# Altium schematic sheet Connector_Section.SchDoc
size A4; DocumentNumber: 9; SheetNumber: 9; SheetTotal: 8
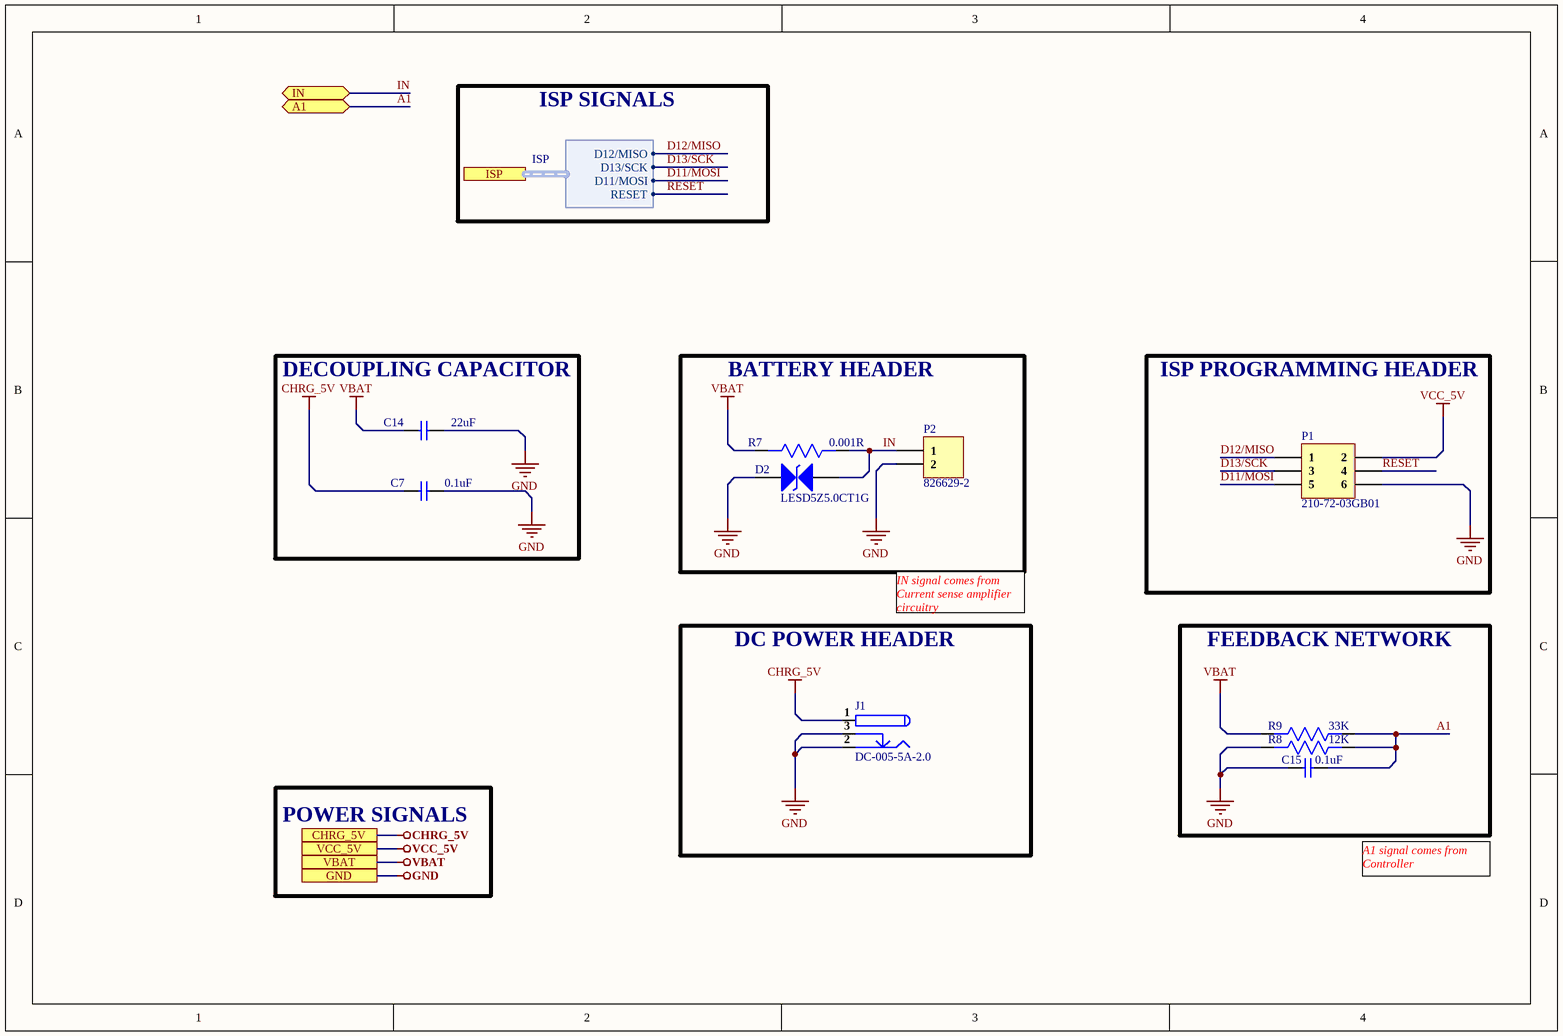
[diagram p0: Connector_Section.SchDoc]

## Parts
C7  0.1uF  [Cap0603]
C14  22uF  [Cap0805]
C15  0.1uF  [Cap0603]
D2  LESD5Z5.0CT1G  [LESD5Z5.0CT1G]
J1  DC-005-5A-2.0  [DC-005-5A-2.0]
P1  210-72-03GB01  [HDR2X3]
P2  826629-2  [HDR1X2]
R7  0.001R  [RES 2512]
R8  12K  [Res0603]
R9  33K  [Res0603]

## Blocks framed on the sheet
DECOUPLING CAPACITOR: C7 C14
BATTERY HEADER: D2 P2 R7
ISP PROGRAMMING HEADER: P1
DC POWER HEADER: J1
FEEDBACK NETWORK: C15 R8 R9

## Ports
A1 (bidir), CHRG_5V, GND, IN (bidir), ISP (harness ISP), VBAT, VCC_5V

## Harnesses
ISP: D12/MISO, D13/SCK, D11/MOSI, RESET

## Nets
CHRG_5V: C7.1 J1.1 ; port CHRG_5V
GND: C7.2 C14.2 C15.2 D2.1(A) J1.2 J1.3 P1.6 P2.2 R8.2 ; port GND
VBAT: C14.1 R7.2 R9.2 ; port VBAT
VCC_5V: P1.2 ; port VCC_5V
A1: C15.1 R8.1 R9.1 ; port A1
D11/MOSI: P1.5 ; port ISP.D11/MOSI
D12/MISO: P1.1 ; port ISP.D12/MISO
D13/SCK: P1.3 ; port ISP.D13/SCK
IN: D2.2(A) P2.1 R7.1 ; port IN
RESET: P1.4 ; port ISP.RESET

## Notes on the sheet
- ISP SIGNALS
- IN signal comes from Current sense amplifier circuitry
- POWER SIGNALS
- A1 signal comes from Controller

## Library data of the parts
C7 C15 = CC0603ZRY5V9BB104: CAP CER 0.1UF 50V Y5V 0603; Manufacturer: Yageo; Capacitance: 100nF; Tolerance: 80%; Supplier 1: Digi-Key; Manufacturer Part Number: CC0603ZRY5V9BB104; Stock 1: 15000880; Pricing 1: 1=0.1, 10=0.075, 100=0.0334, 500=0.02386, 1000=0.01874 (USD); Mount: Surface Mount; Case/Package: 0603; Number of Pins: 2; Case Code (Metric): 1608; Case Code (Imperial): 0603; Min Operating Temperature: -30°C; Max Operating Temperature: 85°C; Dielectric: Y5V; Voltage Rating: 50V; Package Quantity: 1; Packaging: Tape and Reel; Voltage Rating (DC): 50V; Termination: SMD/SMT; Composition: Ceramic; Voltage: 50V; Length: 1.6mm; Height: 0.8mm; Width: 0.031inch; Thickness: 0.035inch; Depth: 0.8mm; Radiation Hardening: No; REACH SVHC: No SVHC; Lead Free: Lead Free; Halogen Free: Halogen Free; ComponentLink1URL: http://www.yageo.com/documents/recent/UPY-GPHC_Y5V_6.3V-to-50V_8.pdf?src-supplier=Digi-Key; ComponentLink1Description: http://www.yageo.com/documents/recent/UPY-GPHC_Y5V_6.3V-to-50V_8.pdf?src-supplier=Digi-Key; ComponentLink2URL: http://www.yageo.com/documents/recent/UPY-GPHC_Y5V_6.3V-to-50V_5.pdf?src-supplier=Avnet+Europe; ComponentLink2Description: http://www.yageo.com/documents/recent/UPY-GPHC_Y5V_6.3V-to-50V_5.pdf?src-supplier=Avnet+Europe; ComponentLink3URL: https://www.verical.com/server-webapp/html/getDatasheet?partID=403611&src-supplier=Verical; ComponentLink3Description: https://www.verical.com/server-webapp/html/getDatasheet?partID=403611&src-supplier=Verical; ComponentLink4URL: http://www.mouser.com/ds/2/447/Yageo_UPY-GP_NP0_16V-to-50V_9-358835.pdf?src-supplier=Mouser; ComponentLink4Description: http://www.mouser.com/ds/2/447/Yageo_UPY-GP_NP0_16V-to-50V_9-358835.pdf?src-supplier=Mouser; ComponentLink5URL: http://www.farnell.com/datasheets/1132289.pdf?src-supplier=Element14; ComponentLink5Description: http://www.farnell.com/datasheets/1132289.pdf?src-supplier=Element14; Supplier Part Number 1: 311-1343-1-ND
C14 = C2012X5R1V226MT000E: CAP CER 22UF 35V X5R 0805
D2 = LESD5Z5.0CT1G: SOD-523 ESD Protection Devices ROHS; Manufacturer: UMW; Value: Custom; Manufacturer Part No: LESD5Z5.0CT1G; Package: SOD-523; ComponentLink1Description: LCSC; ComponentLink1URL: https://lcsc.com/product-detail/span-style-background-color-ff0-ESD-span-Protection-Devices_UMW-Youtai-Semiconductor-Co-Ltd-LESD5Z5-0CT1G_C2833276.html
J1 = DC-005-5A-2.0: DC Power Receptacle 2mm 6.2mm 5A 24V Plugin AC/DC Power Connectors ROHS; Manufacturer: XKB Connectivity; Manufacutrer Part No:: DC-005-5A-2.0; Package: Custom; ComponentLink1Description: New link; ComponentLink1URL: https://datasheet.lcsc.com/lcsc/2110151630_XKB-Connectivity-DC-005-5A-2-0_C381116.pdf
P1 = 210-72-03GB01: Straight Square Pins 2.5mm 6.1mm -40℃~+105℃ 2 3mm 6 2.54mm Black Brass 2x3P 2.54mm Plugin,P=2.54mm Pin Headers ROHS; Manufacturer: PINREX; Manufacturer Part no:: 210-72-03GB01; Package: Custom; ComponentLink1Description: New link; ComponentLink1URL: https://lcsc.com/product-detail/Pin-Headers_PINREX-210-72-03GB01_C402781.html
P2 = 826629-2: CONN HEADER VERT 2POS 2.54MM; Manufacturer: TE Connectivity; Manufacturer Part Number: 8266292; Number of Contacts: 2; Connector Type: Plug,Header,Pin; Current Rating: 3A; Board Standoff: No (Without); High Speed Serial Data Connector: No; PCB Mount Retention: Without; Gender: Male; PCB Mounting Orientation: Vertical; Contact Post Length: 0.1259inch; Plating Thickness: 0.8um; Supplier 1: RSComponents; RoHS: Yes; Category: Board to Board Connectors; Mount: Straddle Mount; Contact Plating: Gold,Tin; Contact Material: Bronze; Color: Green; Housing Color: Green; Housing Material: PBT; Contact Shape: Square; Min Operating Temperature: -65°C; Max Operating Temperature: 105°C; Number of Rows: 1; Termination: Through Hole; Number of Positions: 2; Packaging: Carton; Package Quantity: 3000; Series: AMPMODU MOD II; Contact Type: Male Pin; Contact Gender: Male; Orientation: Straight; Contact Protection: No (Without); Gasket: No (Without); High Temperature Housing: No; Keyed: No; Mating Alignment: No (Without); Mating Connector Lock: No (Without); Selectively Loaded: No (Without); Stabilizers: No (Without); Strain Relief: No (Without); Length: 5.08mm; Pitch: 2.54mm; Contact Mating Length: 6.7mm; Row Spacing: 2.54mm; Depth: 2.5mm; Radiation Hardening: No; Flammability Rating: UL94 V-0; REACH SVHC: No SVHC; ELV: Compliant; Lead Free: Lead Free; ComponentLink1URL: https://datasheet.ciiva.com/11746/0900766b80d7c358-11746248.pdf?src-supplier=RSComponents; ComponentLink1Description: https://datasheet.ciiva.com/11746/0900766b80d7c358-11746248.pdf?src-supplier=RSComponents; ComponentLink2URL: https://datasheet.ciiva.com/30224/8266292-30224019.pdf?src-supplier=Onlinecomponents.com; ComponentLink2Description: https://datasheet.ciiva.com/30224/8266292-30224019.pdf?src-supplier=Onlinecomponents.com; ComponentLink3URL: https://datasheet.ciiva.com/29369/001094754-da-01-en-stiftleiste-1-reihig-0-0826629-2-29369600.pdf?src-supplier=Conrad; ComponentLink3Description: https://datasheet.ciiva.com/29369/001094754-da-01-en-stiftleiste-1-reihig-0-0826629-2-29369600.pdf?src-supplier=Conrad; ComponentLink4URL: https://datasheet.ciiva.com/6857/eng-cd-826629-aa-basefilename-6857135.pdf?src-supplier=Digi-Key; ComponentLink4Description: https://datasheet.ciiva.com/6857/eng-cd-826629-aa-basefilename-6857135.pdf?src-supplier=Digi-Key; ComponentLink5URL: https://datasheet.ciiva.com/14120/eh826629-draw-14120837.pdf?src-supplier=Distrelec; ComponentLink5Description: https://datasheet.ciiva.com/14120/eh826629-draw-14120837.pdf?src-supplier=Distrelec; Supplier Part Number 1: 1361864
R7 = PA2512JKF7W0R001E: RES 0.001 OHM 5% 2W 2512; Manufacturer: YEGEO; Manufacturer Part No:: PA2512JKF7W0R001E; Value: 0.001R; Package: 2512; ComponentLink1Description: New link; ComponentLink1URL: https://www.digikey.ca/en/products/detail/yageo/PA2512JKF7W0R001E/5913675?s=N4IgTCBcDaIAoEEwFYCMYBSBpAYgdgHUAGAJSKNQFEQBdAXyA
R8 = ERJ3EKF1202V: RES SMD 12K OHM 1% 1/10W 0603; Manufacturer: Panasonic; Resistance: 12kR; Temperature Coefficient: 100ppm/°C; Power Rating: 100mW; Voltage Rating: 75V; Supplier 1: RSComponents; Manufacturer Part Number: ERJ3EKF1202V; RoHS: Yes; Category: Chip SMD Resistors; Stock 1: 197000; Pricing 1: 1000=0.00500 (GBP); Mount: Surface Mount; Case/Package: 0603; Number of Pins: 2; Contact Plating: Tin; Case Code (Metric): 1608; Case Code (Imperial): 0603; Weight: 7.1E-05oz; Min Operating Temperature: -55°C; Max Operating Temperature: 155°C; Tolerance: 1%; Resistor Type: Thick Film; Packaging: Tape and Reel; Package Quantity: 5000; Number of Terminations: 2; Termination: SMD/SMT; Max Power Dissipation: 100mW; Voltage Rating (DC): 75V; Features: Automotive AEC-Q200; Series: ERJ; Resistance Tolerance: 1%; Construction: Rectangular; Length: 1.6mm; Width: 0.8mm; Height: 0.45mm; Depth: 0.8mm; Radiation Hardening: No; REACH SVHC: No SVHC; Military Standard: Not; Lead Free: Lead Free; RoHS Compliant: Yes; ComponentLink1URL: https://datasheet.ciiva.com/6138/aoa0000ce2-6138712.pdf?src-supplier=Farnell; ComponentLink1Description: https://datasheet.ciiva.com/6138/aoa0000ce2-6138712.pdf?src-supplier=Farnell; ComponentLink2URL: https://datasheet.ciiva.com/7944/aoa0000ce2-7944617.pdf?src-supplier=Element14; ComponentLink2Description: https://datasheet.ciiva.com/7944/aoa0000ce2-7944617.pdf?src-supplier=Element14; ComponentLink3URL: https://datasheet.ciiva.com/22673/1678782-22673693.pdf?src-supplier=Element14; ComponentLink3Description: https://datasheet.ciiva.com/22673/1678782-22673693.pdf?src-supplier=Element14; ComponentLink4URL: https://datasheet.ciiva.com/22687/1678782-22687413.pdf?src-supplier=Element14; ComponentLink4Description: https://datasheet.ciiva.com/22687/1678782-22687413.pdf?src-supplier=Element14; ComponentLink5URL: https://datasheet.ciiva.com/46420/1678782-46420333.pdf?src-supplier=Element14; ComponentLink5Description: https://datasheet.ciiva.com/46420/1678782-46420333.pdf?src-supplier=Element14; ComponentLink6URL: https://datasheet.ciiva.com/24165/aoa0000ce2-24165037.pdf?src-supplier=Mouser; ComponentLink6Description: https://datasheet.ciiva.com/24165/aoa0000ce2-24165037.pdf?src-supplier=Mouser; ComponentLink7URL: https://datasheet.ciiva.com/16783/70260748-16783400.pdf?src-supplier=Allied+Electronics; ComponentLink7Description: https://datasheet.ciiva.com/16783/70260748-16783400.pdf?src-supplier=Allied+Electronics; ComponentLink8URL: https://datasheet.ciiva.com/30121/aoa0000ce2-30121109.pdf?src-supplier=Onlinecomponents.com; ComponentLink8Description: https://datasheet.ciiva.com/30121/aoa0000ce2-30121109.pdf?src-supplier=Onlinecomponents.com; ComponentLink9URL: https://datasheet.ciiva.com/17211/aoa0000ce2-17211797.pdf?src-supplier=Avnet+Europe; ComponentLink9Description: https://datasheet.ciiva.com/17211/aoa0000ce2-17211797.pdf?src-supplier=Avnet+Europe; ComponentLink10URL: https://datasheet.ciiva.com/16511/aoa0000ce2-16511882.pdf?src-supplier=Avnet+Asia; ComponentLink10Description: https://datasheet.ciiva.com/16511/aoa0000ce2-16511882.pdf?src-supplier=Avnet+Asia; Supplier Part Number 1: 1763579
R9 = AC0603FR-0733KL: Res Thick Film 0603 33K Ohm 1% 1/10W ±100ppm/°C Molded SMD Paper T/R; Manufacturer: Yageo; Resistance: 33kR; Power Rating: 100mW; Voltage Rating: 50V; Supplier 1: Digi-Key; Manufacturer Part Number: AC0603FR-0733KL; RoHS: Yes; Category: Chip SMD Resistors; Stock 1: 9255; Pricing 1: 1=0.10000, 10=0.02900, 100=0.01170, 1000=0.00527, 2500=0.00458 (USD); Case/Package: 0603; Case Code (Imperial): 0603; Case Code (Metric): 1608; Min Operating Temperature: -55°C; Max Operating Temperature: 155°C; Tolerance: 1%; Packaging: Tape and Reel; Resistor Type: Thick Film; Number of Terminations: 2; Termination: SMD/SMT; Max Power Dissipation: 100mW; Temperature Coefficient: 100ppm/°C; Features: Moisture Resistant,Automotive AEC-Q200; Series: AC; Construction: Rectangular; Length: 1.6mm; Width: 0.031inch; Height: 0.022inch; Depth: 0.8mm; Military Standard: Not; Lead Free: Lead Free; RoHS Compliant: Yes; ComponentLink1URL: http://components.arrow.com/part/dataview/0323_03349868?src-supplier=Arrow+Europe; ComponentLink1Description: http://components.arrow.com/part/dataview/0323_03349868?src-supplier=Arrow+Europe; ComponentLink2URL: http://www.yageo.com/NewPortal/yageodocoutput?fileName=/pdf/R-Chip/PYu-AC_51_RoHS_L_6.pdf&src-supplier=Arrow+Electronics; ComponentLink2Description: http://www.yageo.com/NewPortal/yageodocoutput?fileName=/pdf/R-Chip/PYu-AC_51_RoHS_L_6.pdf&src-supplier=Arrow+Electronics; ComponentLink3URL: http://www.yageo.com/NewPortal/yageodocoutput?fileName=/pdf/R-Chip/PYu-AC_51_RoHS_L_6.pdf&src-supplier=Digi-Key; ComponentLink3Description: http://www.yageo.com/NewPortal/yageodocoutput?fileName=/pdf/R-Chip/PYu-AC_51_RoHS_L_6.pdf&src-supplier=Digi-Key; ComponentLink4URL: http://www.yageo.com/documents/recent/PYu-AC_51_RoHS_L_2.pdf?src-supplier=Future+Electronics; ComponentLink4Description: http://www.yageo.com/documents/recent/PYu-AC_51_RoHS_L_2.pdf?src-supplier=Future+Electronics; ComponentLink5URL: http://www.yageo.com/NewPortal/yageodocoutput?fileName=/pdf/R-Chip/PYu-AC_51_RoHS_L_6.pdf&src-supplier=Mouser; ComponentLink5Description: http://www.yageo.com/NewPortal/yageodocoutput?fileName=/pdf/R-Chip/PYu-AC_51_RoHS_L_6.pdf&src-supplier=Mouser; ComponentLink6URL: http://www.yageo.com/NewPortal/yageodocoutput?fileName=/pdf/R-Chip/PYu-AC_51_RoHS_L_6.pdf&src-supplier=Rutronik; ComponentLink6Description: http://www.yageo.com/NewPortal/yageodocoutput?fileName=/pdf/R-Chip/PYu-AC_51_RoHS_L_6.pdf&src-supplier=Rutronik; ComponentLink7URL: http://www.yageo.com/NewPortal/yageodocoutput?fileName=/pdf/R-Chip/PYu-AC_51_RoHS_L_6.pdf&src-supplier=Schukat; ComponentLink7Description: http://www.yageo.com/NewPortal/yageodocoutput?fileName=/pdf/R-Chip/PYu-AC_51_RoHS_L_6.pdf&src-supplier=Schukat; ComponentLink8URL: http://www.yageo.com/NewPortal/yageodocoutput?fileName=/pdf/R-Chip/PYu-AC_51_RoHS_L_6.pdf&src-supplier=TTI; ComponentLink8Description: http://www.yageo.com/NewPortal/yageodocoutput?fileName=/pdf/R-Chip/PYu-AC_51_RoHS_L_6.pdf&src-supplier=TTI; Supplier Part Number 1: YAG3598CT-ND